# Altium schematic sheet Button LED Power.SchDoc
size A; SheetNumber: 6; SheetTotal: 7
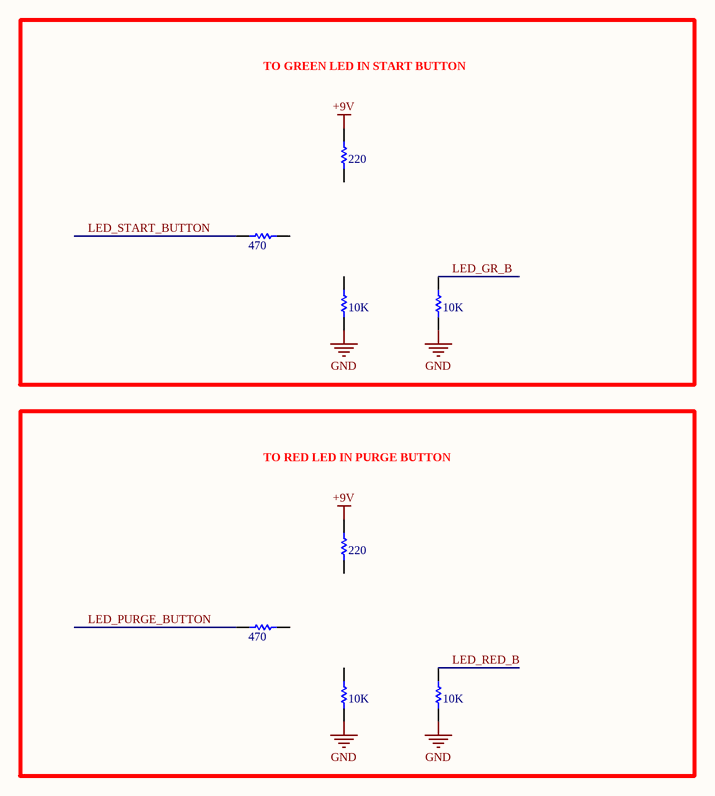
[diagram p0: Button LED Power.SchDoc]

## Parts
(Parts that share a designator on the sheet are numbered #1, #2 ... from top to bottom, then left to right.)
?#1  220  [RESA60-630X240]
?#2  470  [RESA60-630X240]
?#3  10K  [RESA60-630X240]
?#4  10K  [RESA60-630X240]
?#5  220  [RESA60-630X240]
?#6  470  [RESA60-630X240]
?#7  10K  [RESA60-630X240]
?#8  10K  [RESA60-630X240]

## Blocks framed on the sheet
TO GREEN LED IN START BUTTON: ?#1-?#4
TO RED LED IN PURGE BUTTON: ?#5-?#8

## Nets
+9V: ?#1.2 ?#5.2
GND: ?#3.1 ?#4.1 ?#7.1 ?#8.1
LED_GR_B: ?#4.2
LED_PURGE_BUTTON: ?#6.1
LED_RED_B: ?#8.2
LED_START_BUTTON: ?#2.1

Not connected (* = marked no-connect by the designer): ?#1 1; ?#2 2; ?#3 2; ?#5 1; ?#6 2; ?#7 2

## Library data of the parts
?#1-?#8 = CMP-1659-00070-1: Axial Resistor, 1 MOhm, +/- 1%, 250 mW, -55 to 155 degC, 2-Pin THD, RoHS, Bulk; Power Rating: 250 mW; Resistance: 47.5 kohm; Voltage Rating: 250 V; ComponentLink1Description: Manufacturer URL; PackageReference: MFR-25; ComponentLink2Description: Datasheet; ComponentLink2URL: http://www.yageo.com/documents/recent/Yageo%20LR_MFR_2013.pdf; Tolerance: 1%; DatasheetVersion: Apr-13; Package Quantity: 200; Packaging: Bulk; Case\Package: Axial; RoHSCompliant: true; ComponentLink1URL: http://www.yageo.com/; Length: 0.248 inch; Min Operating Temperature: -55 degC; Mount: Through Hole; PackageDescription: 2-Pin Axial Lead, Dia 2.4 mm, Body Length 6.3 mm; Max Operating Temperature: 155 degC